# Altium schematic sheet obstacle robot 1.SchDoc
size A4; SheetNumber: 1; SheetTotal: 1
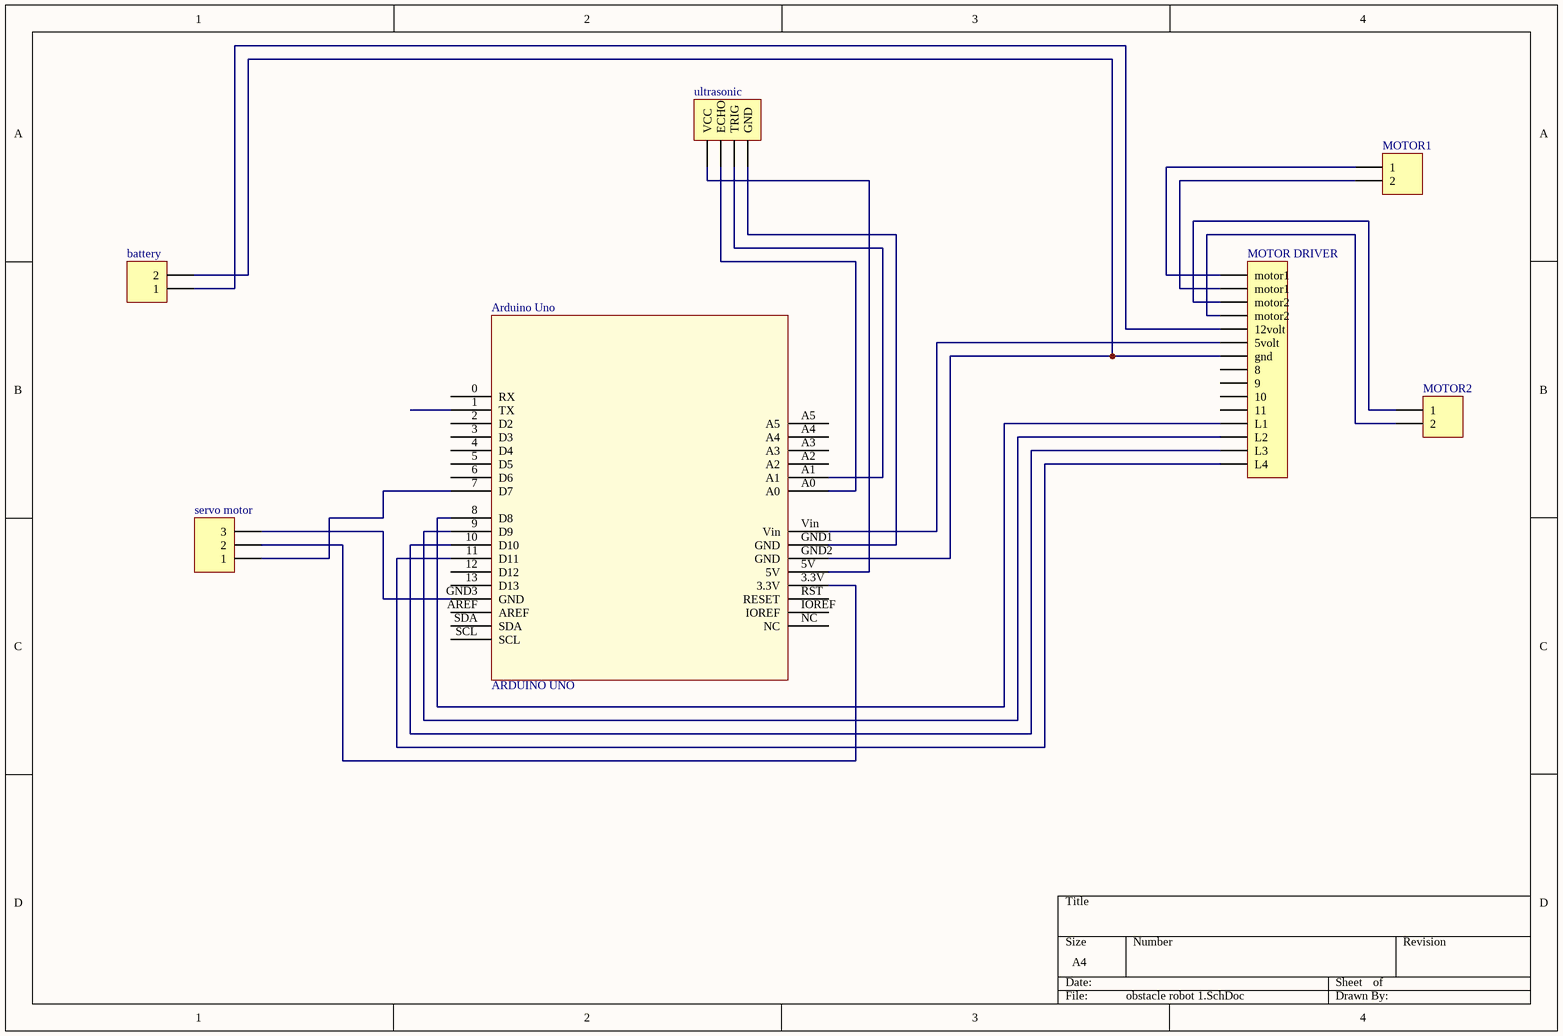
[diagram p0: obstacle robot 1.SchDoc]

## Parts
Arduino_Uno  ARDUINO UNO  [ARDUINO UNO]
battery  Header 2  [HDR1X2]  (value not drawn)
MOTOR1  Header 2  [HDR1X2]  (value not drawn)
MOTOR2  Header 2  [HDR1X2]  (value not drawn)
MOTOR_DRIVER  Header 15  [HDR1X15]  (value not drawn)
servo_motor  Header 3  [HDR1X3]  (value not drawn)
ultrasonic  Header 4  [HDR1X4]  (value not drawn)

## Nets
NetArduino_Uno_3.3V: Arduino_Uno.3.3V servo_motor.2
NetArduino_Uno_5V: Arduino_Uno.5V ultrasonic.1(VCC)
NetArduino_Uno_7: Arduino_Uno.7(D7) servo_motor.1
NetArduino_Uno_8: Arduino_Uno.8(D8) MOTOR_DRIVER.12(L1)
NetArduino_Uno_9: Arduino_Uno.9(D9) MOTOR_DRIVER.13(L2)
NetArduino_Uno_10: Arduino_Uno.10(D10) MOTOR_DRIVER.14(L3)
NetArduino_Uno_11: Arduino_Uno.11(D11) MOTOR_DRIVER.15(L4)
NetArduino_Uno_A0: Arduino_Uno.A0 ultrasonic.2(ECHO)
NetArduino_Uno_A1: Arduino_Uno.A1 ultrasonic.3(TRIG)
NetArduino_Uno_GND1: Arduino_Uno.GND1(GND) ultrasonic.4(GND)
NetArduino_Uno_GND2: Arduino_Uno.GND2(GND) battery.2 MOTOR_DRIVER.7(gnd)
NetArduino_Uno_GND3: Arduino_Uno.GND3(GND) servo_motor.3
NetArduino_Uno_Vin: Arduino_Uno.Vin MOTOR_DRIVER.6(5volt)
Netbattery_1: battery.1 MOTOR_DRIVER.5(12volt)
NetMOTOR1_1: MOTOR1.1 MOTOR_DRIVER.1(motor1)
NetMOTOR1_2: MOTOR1.2 MOTOR_DRIVER.2(motor1)
NetMOTOR2_1: MOTOR2.1 MOTOR_DRIVER.3(motor2)
NetMOTOR2_2: MOTOR2.2 MOTOR_DRIVER.4(motor2)

Not connected (* = marked no-connect by the designer): Arduino_Uno 0(RX) 1(TX) 2(D2) 3(D3) 4(D4) 5(D5) 6(D6) 12(D12) 13(D13) A2 A3 A4 A5 AREF IOREF NC RST(RESET) SCL SDA; MOTOR_DRIVER 8 9 10 11

## Library data of the parts
battery MOTOR1 MOTOR2 = Header 2: Header, 2-Pin; LatestRevisionDate: 17-Jul-2002; LatestRevisionNote: Re-released for DXP Platform.; Publisher: Altium Limited
MOTOR_DRIVER = Header 15: Header, 15-Pin; LatestRevisionDate: 17-Jul-2002; LatestRevisionNote: Re-released for DXP Platform.; Publisher: Altium Limited
servo_motor = Header 3: Header, 3-Pin; LatestRevisionDate: 17-Jul-2002; LatestRevisionNote: Re-released for DXP Platform.; Publisher: Altium Limited
ultrasonic = Header 4: Header, 4-Pin; LatestRevisionDate: 17-Jul-2002; LatestRevisionNote: Re-released for DXP Platform.; Publisher: Altium Limited